# EAGLE design sweef_platine_v5 (EAGLE 9.6.2)
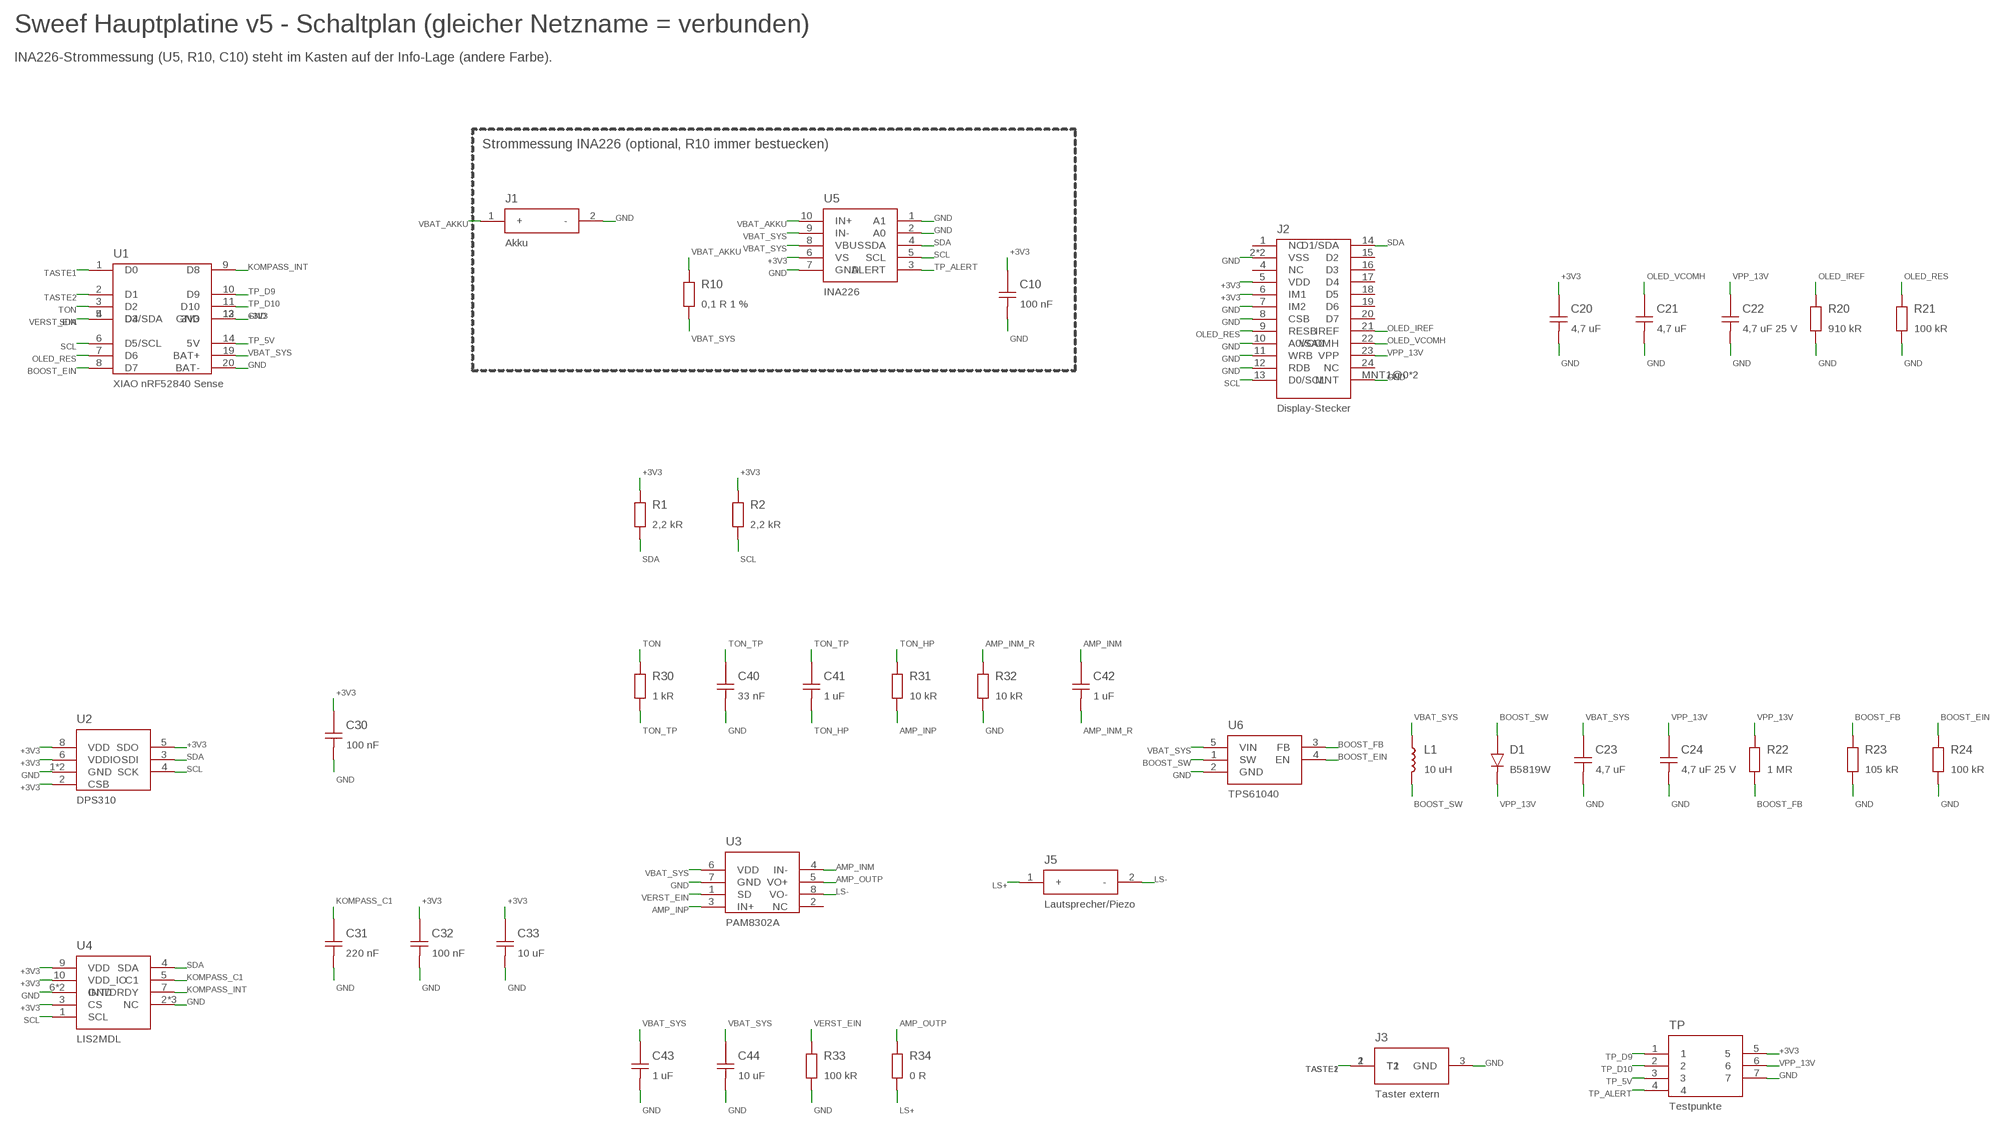
[diagram p0: schematic, sheet 1]

## Parts
C10  100 nF  DS_C10  [C0402]
C20  4,7 uF  DS_C20  [0603-NO]
C21  4,7 uF  DS_C21  [0603-NO]
C22  4,7 uF 25 V  DS_C22  [0805-NO]
C23  4,7 uF  DS_C23  [0603-NO]
C24  4,7 uF 25 V  DS_C24  [0805-NO]
C30  100 nF  DS_C30  [C0402]
C31  220 nF  DS_C31  [C0402]
C32  100 nF  DS_C32  [C0402]
C33  10 uF  DS_C33  [0603-NO]
C40  33 nF  DS_C40  [C0402]
C41  1 uF  DS_C41  [C0402]
C42  1 uF  DS_C42  [C0402]
C43  1 uF  DS_C43  [C0402]
C44  10 uF  DS_C44  [0603-NO]
D1  B5819W  DS_D1  [SOD-123]
J1  Akku  DS_J1  [PADS_2_AKKU]
J2  Display-Stecker  DS_J2  [FPC-24_XUNPU_FPC-05FB-24PH20]
J3  Taster extern  DS_J3  [PADS_3_TASTER]
J5  Lautsprecher/Piezo  DS_J5  [PADS_2_LS]
L1  10 uH  DS_L1  [INDUCTOR_3X3]
R1  2,2 kR  DS_R1  [R0402]
R2  2,2 kR  DS_R2  [R0402]
R10  0,1 R 1 %  DS_R10  [0805-NO]
R20  910 kR  DS_R20  [R0402]
R21  100 kR  DS_R21  [R0402]
R22  1 MR  DS_R22  [R0402]
R23  105 kR  DS_R23  [R0402]
R24  100 kR  DS_R24  [R0402]
R30  1 kR  DS_R30  [R0402]
R31  10 kR  DS_R31  [R0402]
R32  10 kR  DS_R32  [R0402]
R33  100 kR  DS_R33  [R0402]
R34  0 R  DS_R34  [0603-NO]
TP  Testpunkte  DS_TP  [TP_7]
U1  XIAO nRF52840 Sense  DS_U1  [XIAO_NRF52840_SMD]
U2  DPS310  DS_U2  [BMX280_COMBO]
U3  PAM8302A  DS_U3  [MSOP8_0.65MM]
U4  LIS2MDL  DS_U4  [LGA12_2X2MM]
U5  INA226  DS_U5  [MSOP10]
U6  TPS61040  DS_U6  [SOT23-5]

## Nets
+3V3: C10.1 C20.1 C30.1 C32.1 C33.1 J2.5(VDD) J2.6(IM1) R1.1 R2.1 TP.5 U1.12(3V3) U2.2(CSB) U2.5(SDO) U2.6(VDDIO) U2.8(VDD) U4.3(CS) U4.9(VDD) U4.10(VDD_IO) U5.6(VS)
AMP_INM: C42.1 U3.4(IN-)
AMP_INM_R: C42.2 R32.1
AMP_INP: R31.2 U3.3(IN+)
AMP_OUTP: R34.1 U3.5(VO+)
BOOST_EIN [Strom]: R24.1 U1.8(D7) U6.4(EN)
BOOST_FB: R22.2 R23.1 U6.3(FB)
BOOST_SW [Strom]: D1.A L1.P$2 U6.1(SW)
GND: C10.2 C20.2 C21.2 C22.2 C23.2 C24.2 C30.2 C31.2 C32.2 C33.2 C40.2 C43.2 C44.2 J1.2(-) J2.2(VSS) J2.3(VSS) J2.7(IM2) J2.8(CSB) J2.10(A0/SA0) J2.11(WRB) J2.12(RDB) J2.MNT1@0(MNT) J2.MNT2@0(MNT) J3.3(GND) R20.2 R21.2 R23.2 R24.2 R32.2 R33.2 TP.7 U1.13(GND) U1.20(BAT-) U2.1(GND) U2.7(GND) U3.7(GND) U4.2(NC) U4.6(GND) U4.8(GND) U4.11(NC) U4.12(NC) U5.1(A1) U5.2(A0) U5.7(GND) U6.2(GND)
KOMPASS_C1: C31.1 U4.5(C1)
KOMPASS_INT: U1.9(D8) U4.7(INT/DRDY)
LS+ [Strom]: J5.1(+) R34.2
LS- [Strom]: J5.2(-) U3.8(VO-)
OLED_IREF: J2.21(IREF) R20.1
OLED_RES: J2.9(RESB) R21.1 U1.7(D6)
OLED_VCOMH: C21.1 J2.22(VCOMH)
SCL: J2.13(D0/SCL) R2.2 U1.6(D5/SCL) U2.4(SCK) U4.1(SCL) U5.5(SCL)
SDA: J2.14(D1/SDA) R1.2 U1.5(D4/SDA) U2.3(SDI) U4.4(SDA) U5.4(SDA)
TASTE1: J3.1(T1) U1.1(D0)
TASTE2: J3.2(T2) U1.2(D1)
TON: R30.1 U1.3(D2)
TON_HP: C41.2 R31.1
TON_TP: C40.1 C41.1 R30.2
TP_5V: TP.3 U1.14(5V)
TP_ALERT: TP.4 U5.3(ALERT)
TP_D9: TP.1 U1.10(D9)
TP_D10: TP.2 U1.11(D10)
VBAT_AKKU [Strom]: J1.1(+) R10.1 U5.10(IN+)
VBAT_SYS [Strom]: C23.1 C43.1 C44.1 L1.P$1 R10.2 U1.19(BAT+) U3.6(VDD) U5.8(VBUS) U5.9(IN-) U6.5(VIN)
VERST_EIN [Strom]: R33.1 U1.4(D3) U3.1(SD)
VPP_13V: C22.1 C24.1 D1.C J2.23(VPP) R22.1 TP.6
Unconnected: J2.1(NC) J2.4(NC) J2.15(D2) J2.16(D3) J2.17(D4) J2.18(D5) J2.19(D6) J2.20(D7) J2.24(NC) U3.2(NC)

## Notes on the sheet
- Sweef Hauptplatine v5 - Schaltplan (gleicher Netzname = verbunden)
- INA226-Strommessung (U5, R10, C10) steht im Kasten auf der Info-Lage (andere Farbe).
- Strommessung INA226 (optional, R10 immer bestuecken)

## Library data of the parts
C10 = sweef:DS_C10: Abblock INA226; GEHAEUSE: 0402
C20 = sweef:DS_C20: VDD Display; GEHAEUSE: 0603
C21 = sweef:DS_C21: VCOMH; GEHAEUSE: 0603
C22 = sweef:DS_C22: VPP am Stecker; GEHAEUSE: 0805
C23 = sweef:DS_C23: Eingang Wandler; GEHAEUSE: 0603
C24 = sweef:DS_C24: Ausgang Wandler; GEHAEUSE: 0805
C30 = sweef:DS_C30: Abblock DPS310; GEHAEUSE: 0402
C31 = sweef:DS_C31: C1-Kondensator LIS2MDL; GEHAEUSE: 0402
C32 = sweef:DS_C32: Abblock LIS2MDL; GEHAEUSE: 0402
C33 = sweef:DS_C33: Abblock LIS2MDL; GEHAEUSE: 0603
C40 = sweef:DS_C40: Tonfilter Tiefpass; GEHAEUSE: 0402
C41 = sweef:DS_C41: Tonfilter Hochpass; GEHAEUSE: 0402
C42 = sweef:DS_C42: Eingang IN-; GEHAEUSE: 0402
C43 = sweef:DS_C43: Abblock Verstaerker; GEHAEUSE: 0402
C44 = sweef:DS_C44: Abblock Verstaerker; GEHAEUSE: 0603
D1 = sweef:DS_D1: Schottky-Diode Wandler; GEHAEUSE: SOD-123
J1 = sweef:DS_J1: LiPo 3,7 V 300 mAh (602030) mit Schutzschaltung; GEHAEUSE: 2 Loetpads (+/-)
J2 = sweef:DS_J2: Flachbandkabel des Displayglases GME128128-02, um die Kante nach hinten; GEHAEUSE: FPC 24 Pol 0,5 mm, Kontakte oben (XUNPU FPC-05FB-24PH20)
J3 = sweef:DS_J3: Edelstahl-Taster (extern); GEHAEUSE: 3 Loetpads
J5 = sweef:DS_J5: Lautsprecher 8 R oder Piezoscheibe; GEHAEUSE: 2 Loetpads 1,5 x 2 mm
L1 = sweef:DS_L1: Spule Wandler; GEHAEUSE: Spule 3x3 mm (geschirmt)
R1 = sweef:DS_R1: I²C-Pull-up SDA; GEHAEUSE: 0402
R2 = sweef:DS_R2: I²C-Pull-up SCL; GEHAEUSE: 0402
R10 = sweef:DS_R10: Strom-Messwiderstand (Shunt); GEHAEUSE: 0805
R20 = sweef:DS_R20: IREF (Helligkeit-Referenz); GEHAEUSE: 0402
R21 = sweef:DS_R21: haelt Display im Reset beim Start; GEHAEUSE: 0402
R22 = sweef:DS_R22: Spannungsteiler oben; GEHAEUSE: 0402
R23 = sweef:DS_R23: Spannungsteiler unten → 13,0 V; GEHAEUSE: 0402
R24 = sweef:DS_R24: Wandler aus, solange der XIAO schlaeft; GEHAEUSE: 0402
R30 = sweef:DS_R30: Tonfilter Tiefpass; GEHAEUSE: 0402
R31 = sweef:DS_R31: Grundlautstaerke (0 R = lauter); GEHAEUSE: 0402
R32 = sweef:DS_R32: Grundlautstaerke (gleich wie R31); GEHAEUSE: 0402
R33 = sweef:DS_R33: Verstaerker aus beim Start; GEHAEUSE: 0402
R34 = sweef:DS_R34: Lautsprecher: 0 R · Piezo: 22 R; GEHAEUSE: 0603
TP = sweef:DS_TP: Messpunkte / Reserve; GEHAEUSE: Loetpads Ø 1,2 mm
U1 = sweef:DS_U1: Controller, Funk, Lader, IMU, Mikrofon; GEHAEUSE: XIAO-SMD (21 x 17,8)
U2 = sweef:DS_U2: Drucksensor, I²C 0x77 – auf der Zunge in der Sensorkammer; GEHAEUSE: LGA-8 (2,0 x 2,5); LCSC: C130156
U3 = sweef:DS_U3: Verstaerker Klasse D; GEHAEUSE: MSOP-8; LCSC: C113367
U4 = sweef:DS_U4: Kompass (Magnetfeld), I²C 0x1E – weit weg vom Lautsprecher; GEHAEUSE: LGA-12 (2 x 2); LCSC: C919695
U5 = sweef:DS_U5: Strom-/Spannungsmessung Akku, I²C 0x40; GEHAEUSE: MSOP-10; LCSC: C49851
U6 = sweef:DS_U6: Aufwaertswandler 13 V fuer das Display; GEHAEUSE: SOT-23-5; LCSC: C7722

## Net classes
0 default: width 0.2 mm, drill 0.3 mm, clearance 0.15 mm
1 Strom: width 0.3 mm, drill 0.3 mm, clearance 0.15 mm, clearance 0.15 mm to class 0

## Board
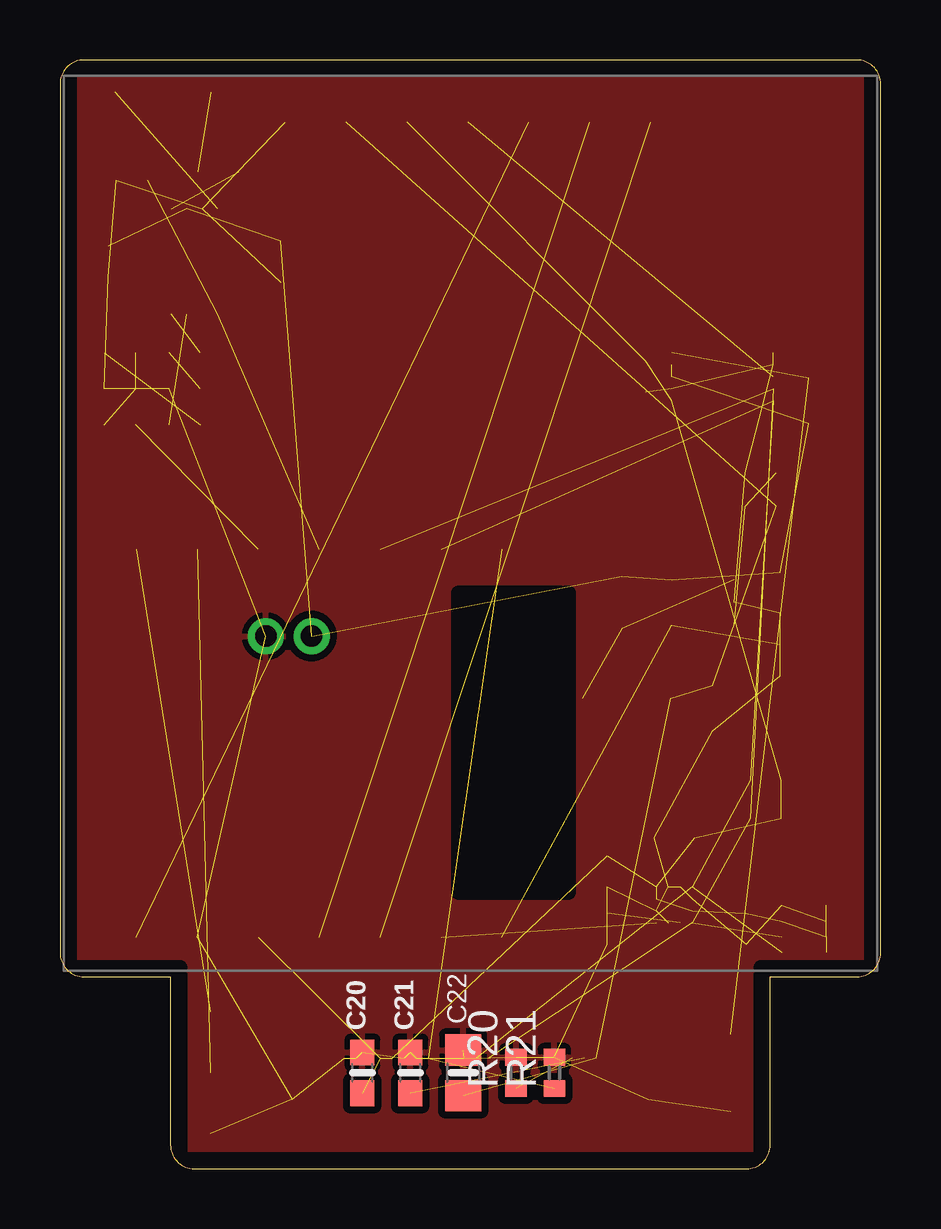
[diagram p1: board, top side]
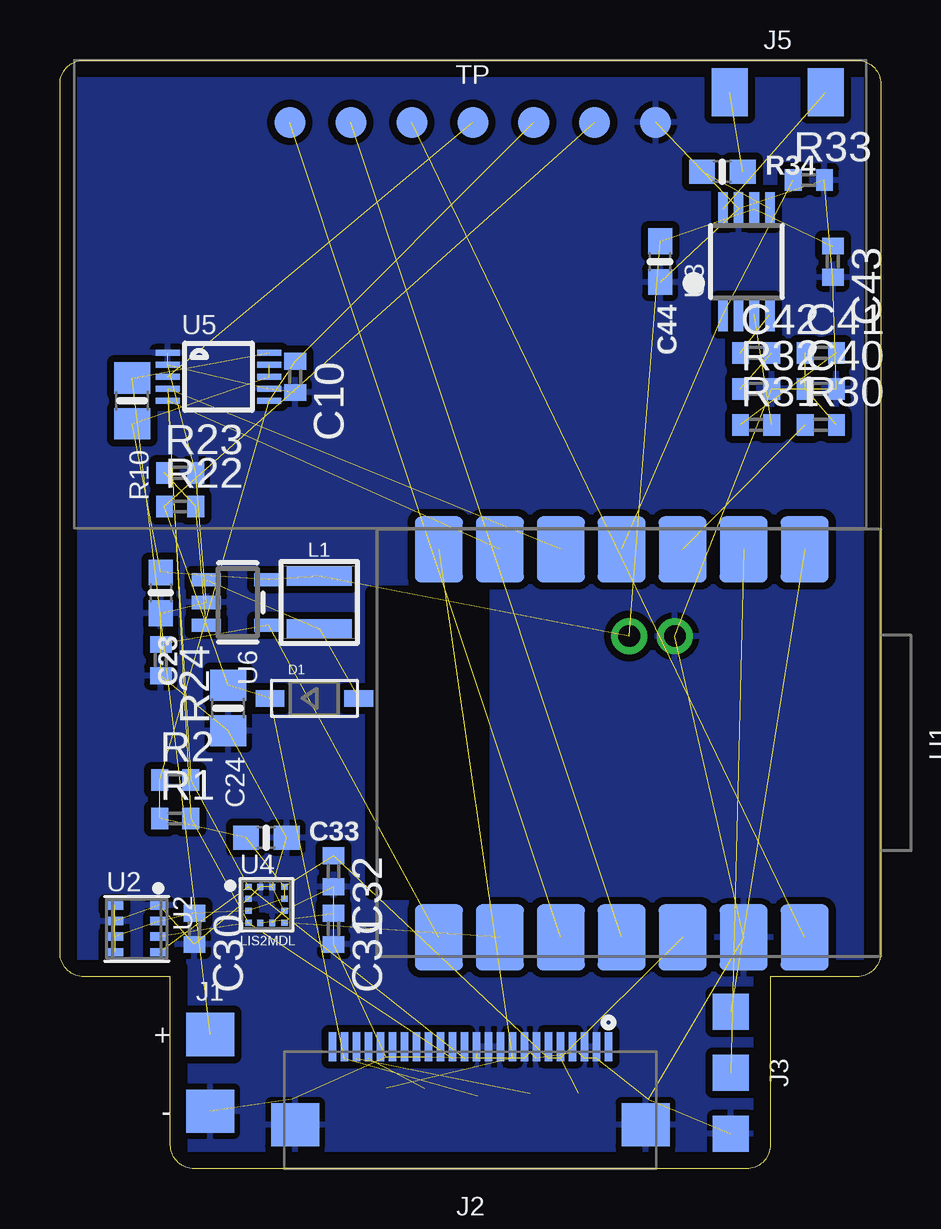
[diagram p2: board, bottom side, seen from below]

Size 34.2 x 46.2 mm. Coordinates in mm from the lower left corner, seen from the top.
Outline: 5.6,0 28.6,0 arc90 29.6,1 29.6,8 33.2,8 arc90 34.2,9 34.2,45.2 arc90 33.2,46.2 1,46.2 arc90 0,45.2 0,9 arc90 1,8 4.6,8 4.6,1 arc90 5.6,0
Copper layers (1*16): Top 0.035mm / dielectric 1.5mm / Bottom 0.035mm
Design rules "Fusion Electronics Design Rules": minimum track width 6mil, minimum drill 0.35mm, track to track 6mil, track to pad 6mil, pad to pad 6mil, via to via 6mil, smd to smd 6mil, copper to edge 0.4mm, drill to drill 6mil, minimum pad ring 10mil, minimum via ring 8mil, stop-mask expansion 4mil, vias tented up to drill 9999mil, thermal gap 10mil
tRestrict: area 16.6,11.5 to 21.2,24; area -1,-1 to 5,8.4; area 29.2,-1 to 35.2,8.4; area -3,-3 to 0.4,49.2; area 33.8,-3 to 37.2,49.2; area -3,45.8 to 37.2,49.2; area -3,-3 to 37.2,0.4
bRestrict: area 16.6,11.5 to 21.2,24; area -1,-1 to 5,8.4; area 29.2,-1 to 35.2,8.4; area -3,-3 to 0.4,49.2; area 33.8,-3 to 37.2,49.2; area -3,45.8 to 37.2,49.2; area -3,-3 to 37.2,0.4
vRestrict: area 16.6,11.5 to 21.2,24; area -1,-1 to 5,8.4; area 29.2,-1 to 35.2,8.4; area -3,-3 to 0.4,49.2; area 33.8,-3 to 37.2,49.2; area -3,45.8 to 37.2,49.2; area -3,-3 to 37.2,0.4

### Footprints (pad centres in the part's own frame; a part is rotated, then mirrored left to right if it is on the bottom)
C0402 = smd 0.7 x 0.9: 1 -0.65,0; 2 0.65,0
0603-NO = smd 1.075 x 1: 1 -0.85,0; 2 0.85,0
0805-NO = smd 1.3 x 1.5: 1 -0.95,0; 2 0.95,0
SOD-123 = smd 1.2 x 0.7: A 1.85,0; C -1.85,0
PADS_2_AKKU = smd 2 x 1.8: 1 0,1.6; 2 0,-1.6
FPC-24_XUNPU_FPC-05FB-24PH20 = smd 0.3 x 1.2: 1 -5.75,-1.84; 2 -5.25,-1.84; 3 -4.75,-1.84; 4 -4.25,-1.84; 5 -3.75,-1.84; 6 -3.25,-1.84; 7 -2.75,-1.84; 8 -2.25,-1.84; 9 -1.75,-1.84; 10 -1.25,-1.84; 11 -0.75,-1.84; 12 -0.25,-1.84; 13 0.25,-1.84; 14 0.75,-1.84; 15 1.25,-1.84; 16 1.75,-1.84; 17 2.25,-1.84; 18 2.75,-1.84; 19 3.25,-1.84; 20 3.75,-1.84; 21 4.25,-1.84; 22 4.75,-1.84; 23 5.25,-1.84; 24 5.75,-1.84 | smd 2 x 1.8: MNT1@0 -7.3,1.41; MNT2@0 7.3,1.41
PADS_3_TASTER = smd 1.5 x 1.5: 1 -2.54,0; 2 0,0; 3 2.54,0
PADS_2_LS = smd 1.5 x 2: 1 -2,0; 2 2,0
INDUCTOR_3X3 = smd 2.7 x 0.8: P$1 0,1.1; P$2 0,-1.1
R0402 = smd 0.7 x 0.9: 1 -0.65,0; 2 0.65,0
TP_7 = smd 1.3 x 1.3: 1 -7.62,0; 2 -5.08,0; 3 -2.54,0; 4 0,0; 5 2.54,0; 6 5.08,0; 7 7.62,0
XIAO_NRF52840_SMD = smd 2.75 x 2: 1 -8.055,7.325; 2 -8.055,4.785; 3 -8.055,2.245; 4 -8.055,-0.295; 5 -8.055,-2.835; 6 -8.055,-5.375; 7 -8.055,-7.915; 8 8.11,-7.915; 9 8.11,-5.375; 10 8.11,-2.835; 11 8.11,-0.295; 12 8.11,2.245; 13 8.11,4.785; 14 8.11,7.325 | drill 0.9 pad 1.5: 19 -4.445,0.018; 20 -4.445,1.923
BMX280_COMBO = smd 0.725 x 0.35: 1 0.925,0.975; 2 0.925,0.325; 3 0.925,-0.325; 4 0.925,-0.975; 5 -0.925,-0.975; 6 -0.925,-0.325; 7 -0.925,0.325; 8 -0.925,0.975
MSOP8_0.65MM = smd 0.4 x 1.4: 1 -0.975,-2.2; 2 -0.325,-2.2; 3 0.325,-2.2; 4 0.975,-2.2; 5 0.975,2.2; 6 0.325,2.2; 7 -0.325,2.2; 8 -0.975,2.2
LGA12_2X2MM = smd 0.275 x 0.25: 1 -0.75,0.75; 2 -0.75,0.25; 3 -0.75,-0.25; 4 -0.75,-0.75; 7 0.75,-0.75; 8 0.75,-0.25; 9 0.75,0.25; 10 0.75,0.75 | smd 0.25 x 0.275: 5 -0.25,-0.75; 6 0.25,-0.75; 11 0.25,0.75; 12 -0.25,0.75
MSOP10 = smd 0.25 x 1: 1 -1,-2.113; 2 -0.5,-2.113; 3 0,-2.113; 4 0.5,-2.113; 5 1,-2.113; 6 1,2.113; 7 0.5,2.113; 8 0,2.113; 9 -0.5,2.113; 10 -1,2.113
SOT23-5 = smd 0.55 x 1.2: 1 -0.95,-1.3; 2 0,-1.3; 3 0.95,-1.3; 4 0.95,1.3; 5 -0.95,1.3

### Placement (x,y rotation side)
C10  24.4,33 270 bottom
C20  12.6,4 90 top
C21  14.6,4 90 top
C22  16.8,4 90 top
C23  30,24 270 bottom
C24  27.2,19.2 270 bottom
C30  28.6,10 270 bottom
C31  22.8,10 270 bottom
C32  22.8,12.4 270 bottom
C33  25.6,13.8 0 bottom
C40  2.5,32.5 0 bottom
C41  2.5,34 0 bottom
C42  5.2,34 0 bottom
C43  2,37.8 270 bottom
C44  9.2,37.8 270 bottom
D1  23.6,19.6 0 bottom
J1  27.95,4 0 bottom
J2  17.1,3.25 180 bottom
J3  6.25,4 270 bottom
J5  4.3,44.85 0 bottom
L1  23.4,23.6 0 bottom
R1  29.4,14.6 0 bottom
R2  29.4,16.2 0 bottom
R10  31.2,32 270 bottom
R20  19,4 90 top
R21  20.6,4 90 top
R22  29.2,27.6 0 bottom
R23  29.2,29 0 bottom
R24  30,21.2 270 bottom
R30  2.5,31 0 bottom
R31  5.2,31 0 bottom
R32  5.2,32.5 0 bottom
R33  3,41.2 0 bottom
R34  6.6,41.55 0 bottom
TP  17,43.6 0 bottom
U1  10.5,17.75 270 bottom
U2  31,10 0 bottom
U3  5.6,37.8 0 bottom
U4  25.6,11 0 bottom
U5  27.6,33 270 bottom
U6  26.8,23.6 270 bottom

### Tracks (layer width: path | path; a pad name or v marks a point on that pad's centre or on a via)
+3V3  (18 unrouted)
AMP_INM  (1 unrouted)
AMP_INM_R  (1 unrouted)
AMP_INP  (1 unrouted)
AMP_OUTP  (1 unrouted)
BOOST_EIN  (2 unrouted)
BOOST_FB  (2 unrouted)
BOOST_SW  (2 unrouted)
GND  (44 unrouted)
  pour Top (isolate 0.3): 5,0.4 29.2,0.4 29.2,8.4 33.8,8.4 33.8,45.8 0.4,45.8 0.4,8.4 5,8.4
  pour Bottom (isolate 0.3): 5,0.4 29.2,0.4 29.2,8.4 33.8,8.4 33.8,45.8 0.4,45.8 0.4,8.4 5,8.4
KOMPASS_C1  (1 unrouted)
KOMPASS_INT  (1 unrouted)
LS+  (1 unrouted)
LS-  (1 unrouted)
OLED_IREF  (1 unrouted)
OLED_RES  (2 unrouted)
OLED_VCOMH  (1 unrouted)
SCL  (5 unrouted)
SDA  (5 unrouted)
TASTE1  (1 unrouted)
TASTE2  (1 unrouted)
TON  (1 unrouted)
TON_HP  (1 unrouted)
TON_TP  (2 unrouted)
TP_5V  (1 unrouted)
TP_ALERT  (1 unrouted)
TP_D9  (1 unrouted)
TP_D10  (1 unrouted)
VBAT_AKKU  (2 unrouted)
VBAT_SYS  (9 unrouted)
VERST_EIN  (2 unrouted)
VPP_13V  (5 unrouted)

### Text on the board
tDocu: Displayglas vorne 33,9 x 37,3 (Flachbandkabel unten) | Sweef v5
bDocu: Akku 300 mAh hinten 33 x 19,5 x 6 (auf 1,5 mm Schaumstoff, darunter nur flache Teile)